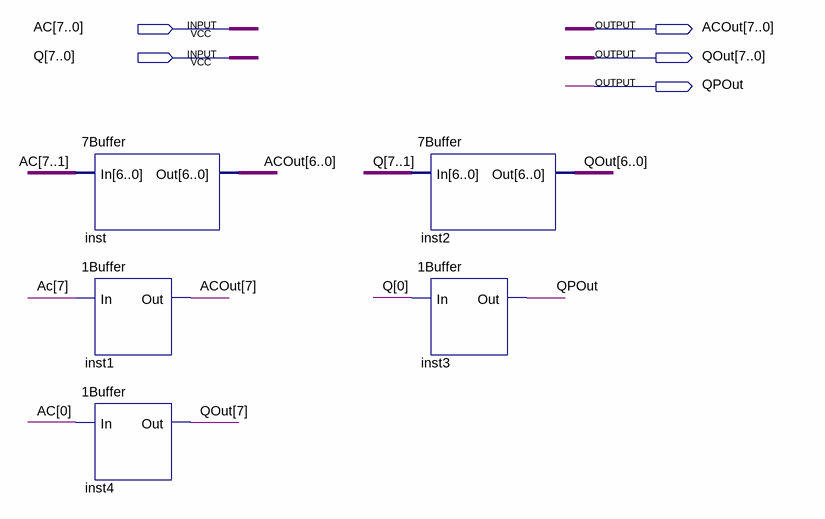
[diagram p0: schematic sheet]
// Quartus schematic 17Shift.bdf as structural Verilog: 5 symbols, 5 pins
module \17Shift  (
  input  [7:0] AC,
  input  [7:0] Q,
  output [7:0] ACOut,
  output [7:0] QOut,
  output QPOut
);

  \7Buffer  inst (.In(AC[7:1]), .Out(ACOut[6:0]));
  \1Buffer  inst1 (.In(AC[7]), .Out(ACOut[7]));
  \1Buffer  inst4 (.In(AC[0]), .Out(QOut[7]));
  \7Buffer  inst2 (.In(Q[7:1]), .Out(QOut[6:0]));
  \1Buffer  inst3 (.In(Q[0]), .Out(QPOut));
endmodule
